# Altium schematic sheet HDMI2.0_SHEET.SchDoc
size A4; SheetNumber: 7; SheetTotal: 10
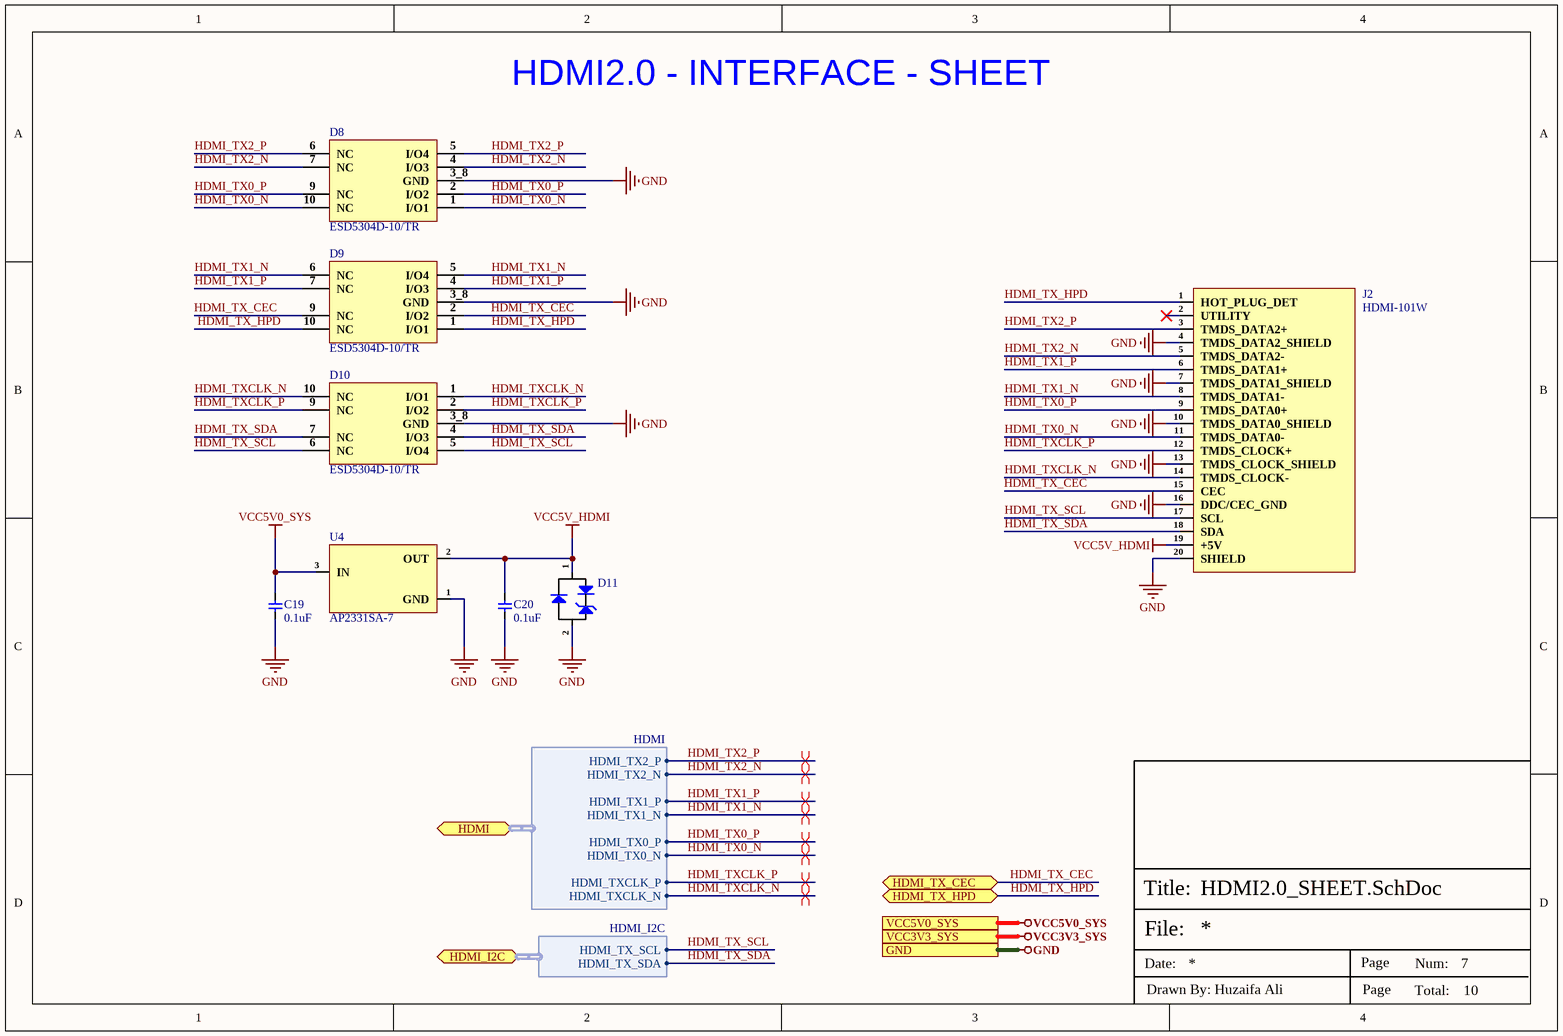
[diagram p0: HDMI2.0_SHEET.SchDoc]

## Parts
C19  0.1uF  [Cap-0402]
C20  0.1uF  [Cap-0402]
D8  ESD5304D-10/TR  [DFN2510-10L_]
D9  ESD5304D-10/TR  [DFN2510-10L_]
D10  ESD5304D-10/TR  [DFN2510-10L_]
D11  ESD5341N-2/TR  [DFN1006-2L_]  (value not drawn)
J2  HDMI-101W  [HDMI-101W]
U4  AP2331SA-7  [SOT-23]

## Ports
GND (see CAN_SHEET[3D], GPS_INTERFACE_SHEET[3D], JOYSTICK_BUTTON_SHEET[3D], MIPI_DISPLAY-SHEET[3D], MISCELLANEOUS_SHEET[3D], POWER_SHEET[3C], radxa_CM3J_SHEET-1[4C], radxa_CM3J_SHEET-2[3D], TYPE-C_INTERFACE_SHEET[3D]), HDMI (bidir, harness HDMI, see radxa_CM3J_SHEET-2[1C]), HDMI_I2C (bidir, harness HDMI_I2C, see radxa_CM3J_SHEET-2[1C]), HDMI_TX_CEC (bidir, see radxa_CM3J_SHEET-2[3D]), HDMI_TX_HPD (bidir, see radxa_CM3J_SHEET-2[3D]), VCC3V3_SYS (see GPS_INTERFACE_SHEET[3D], MIPI_DISPLAY-SHEET[3D], MISCELLANEOUS_SHEET[3D], POWER_SHEET[3C]), VCC5V0_SYS (see CAN_SHEET[3D], MIPI_DISPLAY-SHEET[3D], POWER_SHEET[3C], radxa_CM3J_SHEET-1[4C], TYPE-C_INTERFACE_SHEET[3D])

## Harnesses
HDMI_I2C: HDMI_TX_SCL, HDMI_TX_SDA
HDMI: HDMI_TX2_P, HDMI_TX2_N, HDMI_TX1_P, HDMI_TX1_N, HDMI_TX0_P, HDMI_TX0_N, HDMI_TXCLK_P, HDMI_TXCLK_N

## Nets
GND: C19.1 C20.1 D8.3_8(GND) D9.3_8(GND) D10.3_8(GND) D11.2(A) J2.4(TMDS_DATA2_SHIELD) J2.7(TMDS_DATA1_SHIELD) J2.10(TMDS_DATA0_SHIELD) J2.13(TMDS_CLOCK_SHIELD) J2.16(DDC/CEC_GND) J2.20(SHIELD) U4.1(GND) ; port GND
VCC3V3_SYS: port VCC3V3_SYS
VCC5V0_SYS: C19.2 U4.3(IN) ; port VCC5V0_SYS
VCC5V_HDMI: C20.2 D11.1(K) J2.19(+5V) U4.2(OUT)
HDMI_TX0_N: D8.1(I/O1) D8.10(NC) J2.11(TMDS_DATA0-) ; port HDMI.HDMI_TX0_N
HDMI_TX0_P: D8.2(I/O2) D8.9(NC) J2.9(TMDS_DATA0+) ; port HDMI.HDMI_TX0_P
HDMI_TX1_N: D9.5(I/O4) D9.6(NC) J2.8(TMDS_DATA1-) ; port HDMI.HDMI_TX1_N
HDMI_TX1_P: D9.4(I/O3) D9.7(NC) J2.6(TMDS_DATA1+) ; port HDMI.HDMI_TX1_P
HDMI_TX2_N: D8.4(I/O3) D8.7(NC) J2.5(TMDS_DATA2-) ; port HDMI.HDMI_TX2_N
HDMI_TX2_P: D8.5(I/O4) D8.6(NC) J2.3(TMDS_DATA2+) ; port HDMI.HDMI_TX2_P
HDMI_TX_CEC: D9.2(I/O2) D9.9(NC) J2.15(CEC) ; port HDMI_TX_CEC
HDMI_TX_HPD: D9.1(I/O1) D9.10(NC) J2.1(HOT_PLUG_DET) ; port HDMI_TX_HPD
HDMI_TX_SCL: D10.5(I/O4) D10.6(NC) J2.17(SCL) ; port HDMI_I2C.HDMI_TX_SCL
HDMI_TX_SDA: D10.4(I/O3) D10.7(NC) J2.18(SDA) ; port HDMI_I2C.HDMI_TX_SDA
HDMI_TXCLK_N: D10.1(I/O1) D10.10(NC) J2.14(TMDS_CLOCK-) ; port HDMI.HDMI_TXCLK_N
HDMI_TXCLK_P: D10.2(I/O2) D10.9(NC) J2.12(TMDS_CLOCK+) ; port HDMI.HDMI_TXCLK_P

Not connected (* = marked no-connect by the designer): J2 2(UTILITY)*

## Layout directives
differential pair; differential pair class HDMI_100R: HDMI_TX0_N, HDMI_TX0_P, HDMI_TX1_N, HDMI_TX1_P, HDMI_TX2_N, HDMI_TX2_P, HDMI_TXCLK_N, HDMI_TXCLK_P

## Notes on the sheet
- HDMI2.0 - INTERFACE - SHEET
- File:
- Title:
- Date:
- Page
- Num:
- Total:
- Drawn By: Huzaifa Ali

## Library data of the parts
C19 C20 = GRM155R71H104ME14D: CAP CER 0.1UF 50V X7R 0402; Manufacturer: Murata; Tolerance: 20%; Capacitance: 100nF; Item Type: Capacitor; Supplier 1: Avnet; Manufacturer Part Number: GRM155R71H104ME14D; RoHS: Yes; Category: Ceramic Capacitors; Stock 1: 100000; Pricing 1: 10000=0.00444, 20000=0.00420, 40000=0.00396, 60000=0.00372, 80000=0.00348, 100000=0.00324, 1000000=0.00300 (USD); Mount: Surface Mount; Case/Package: 0402; Min Operating Temperature: -55°C; Max Operating Temperature: 125°C; Packaging: Cut Tape; Voltage Rating: 50V; Length: 0.039inch; Width: 0.02inch; Thickness: 0.022inch; RoHS Compliant: Yes; ComponentLink1URL: http://www.mouser.com/ds/2/281/c02e-2905.pdf?src-supplier=Mouser; ComponentLink1Description: http://www.mouser.com/ds/2/281/c02e-2905.pdf?src-supplier=Mouser; ComponentLink2URL: http://search.murata.co.jp/Ceramy/image/img/A01X/G101/ENG/GRM155R71H104ME14-01.pdf?src-supplier=Digi-Key; ComponentLink2Description: http://search.murata.co.jp/Ceramy/image/img/A01X/G101/ENG/GRM155R71H104ME14-01.pdf?src-supplier=Digi-Key; ComponentLink3URL: http://psearch.en.murata.com/capacitor/product/GRM155R71H104ME14%23.pdf?src-supplier=Avnet; ComponentLink3Description: http://psearch.en.murata.com/capacitor/product/GRM155R71H104ME14%23.pdf?src-supplier=Avnet; Supplier Part Number 1: GRM155R71H104ME14D; LCSC Part Number: C182412
D8-D10 = ESD5304D-10/TR: 4A@8/20us 12V 7V 5V Unidirectional DFN2510-10L TVS ROHS; Manufacturer: WILLSEMI; Item Type: Diode; Package: DFN2510-10L; LCSC Part Number: C153722; Manufacturer Part Number: ESD5304D-10/TR; ComponentLink1Description: LCSC; ComponentLink1URL: https://www.lcsc.com/product-detail/TVS_WILLSEMI-Will-Semicon-ESD5304D-10-TR_C153722.html
D11 = ESD5341N-2/TR: 4A@8/20us 15V 7V 5V Unidirectional DFN1006-2L TVS ROHS; Manufacturer: WILLSEMI; Item Type: Diode; Manufacturer Part Number: ESD5341N-2/TR; Package: DFN1006-2L; ComponentLink1Description: LCSC; ComponentLink1URL: https://www.lcsc.com/product-detail/TVS_WILLSEMI-Will-Semicon-ESD5341N-2-TR_C239773.html; LCSC Part Number: C239773
J2 = HDMI-101W: SMD HDMI Connectors ROHS; Manufacturer: XUNPU; Manufacturer Part Number: HDMI-101W; Package: SMD; LCSC Part Number: C720619; Item Type: Connector; ComponentLink1Description: LCSC; ComponentLink1URL: https://www.lcsc.com/product-detail/HDMI-Connectors_XUNPU-HDMI-101W_C720619.html
U4 = AP2331SA-7: IC CURRENT SWITCH SOT23-3; Manufacturer: Diodes; Supplier: Digikey; Supplier Part Number: AP2331SA-7DICT-ND; Manufacturer Part Number: AP2331SA-7; RoHS: Yes; Category: Hot Swap Controllers; Stock: 19607; Pricing: 1=0.45, 10=0.383, 25=0.3572, 100=0.2859, 250=0.26548, 500=0.22464, 1000=0.17359 (USD); ComponentLink1URL: https://datasheet.ciiva.com/15108/getdatasheetpartid-670771-15108880.pdf?src-supplier=Verical; ComponentLink1Description: https://datasheet.ciiva.com/15108/getdatasheetpartid-670771-15108880.pdf?src-supplier=Verical; ComponentLink2URL: https://datasheet.ciiva.com/4923/ap2331-6844-4923636.pdf?src-supplier=Mouser; ComponentLink2Description: https://datasheet.ciiva.com/4923/ap2331-6844-4923636.pdf?src-supplier=Mouser; ComponentLink3URL: https://datasheet.ciiva.com/8142/ap2331-8142774.pdf?src-supplier=Avnet; ComponentLink3Description: https://datasheet.ciiva.com/8142/ap2331-8142774.pdf?src-supplier=Avnet; ComponentLink4URL: https://datasheet.ciiva.com/1962/ap2331-1962167.pdf?src-supplier=Digikey; ComponentLink4Description: https://datasheet.ciiva.com/1962/ap2331-1962167.pdf?src-supplier=Digikey; ComponentLink5URL: https://datasheet.ciiva.com/1962/ap2331-1962168.pdf?src-supplier=Digikey; ComponentLink5Description: https://datasheet.ciiva.com/1962/ap2331-1962168.pdf?src-supplier=Digikey; ComponentLink6URL: https://datasheet.ciiva.com/1962/ap2331-1962169.pdf?src-supplier=Digikey; ComponentLink6Description: https://datasheet.ciiva.com/1962/ap2331-1962169.pdf?src-supplier=Digikey; LCSC Part Number: C500764; Item Type: IC